# Altium schematic sheet Amplifier_Section.SchDoc
size A4; SheetNumber: 8; SheetTotal: 9
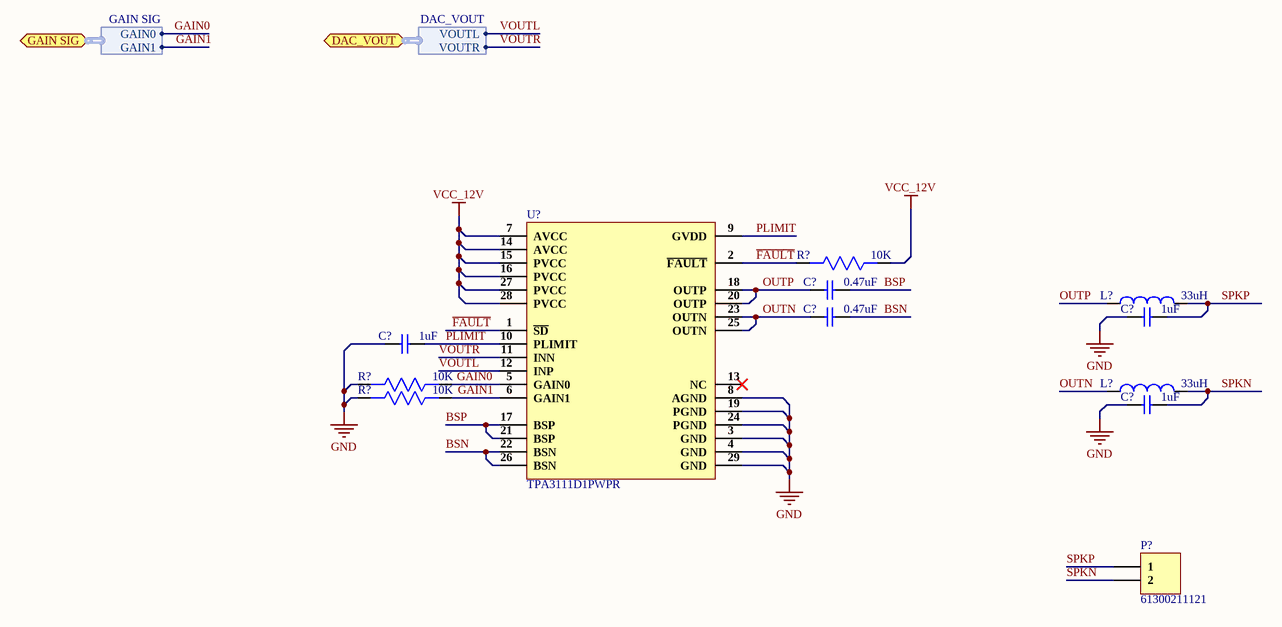
[diagram p0: Amplifier_Section.SchDoc]

## Parts
(Parts that share a designator on the sheet are numbered #1, #2 ... from top to bottom, then left to right.)
C?#1  0.47uF  [Cap0603]
C?#2  0.47uF  [Cap0603]
C?#3  1uF  [Cap0603]
C?#4  1uF  [Cap0603]
C?#5  1uF  [Cap0603]
L?#1  33uH  [SWPA5040S330MT]
L?#2  33uH  [SWPA5040S330MT]
P?  61300211121  [HDR1X2]
R?#1  10K  [Res0603]
R?#2  10K  [Res0603]
R?#3  10K  [Res0603]
U?  TPA3111D1PWPR  [28-HTSSOP]

## Ports
DAC_VOUT (bidir, harness DAC_VOUT), GAIN SIG (bidir, harness GAIN SIG)

## Harnesses
DAC_VOUT: VOUTL, VOUTR
GAIN SIG: GAIN0, GAIN1

## Nets
GND: C?#3.1 C?#4.1 C?#5.1 R?#2.2 R?#3.2 U?.3(GND) U?.4(GND) U?.8(AGND) U?.19(PGND) U?.24(PGND) U?.29(GND)
VCC_12V: R?#1.1 U?.7(AVCC) U?.14(AVCC) U?.15(PVCC) U?.16(PVCC) U?.27(PVCC) U?.28(PVCC)
~{FAULT}: R?#1.2 U?.1(~{SD}) U?.2(~{FAULT})
BSN: C?#2.2 U?.22(BSN) U?.26(BSN)
BSP: C?#1.2 U?.17(BSP) U?.21(BSP)
GAIN0: R?#2.1 U?.5(GAIN0) ; port GAIN SIG.GAIN0
GAIN1: R?#3.1 U?.6(GAIN1) ; port GAIN SIG.GAIN1
OUTN: C?#2.1 L?#2.1 U?.23(OUTN) U?.25(OUTN)
OUTP: C?#1.1 L?#1.1 U?.18(OUTP) U?.20(OUTP)
PLIMIT: C?#4.2 U?.9(GVDD) U?.10(PLIMIT)
SPKN: C?#5.2 L?#2.2 P?.2
SPKP: C?#3.2 L?#1.2 P?.1
VOUTL: U?.12(INP) ; port DAC_VOUT.VOUTL
VOUTR: U?.11(INN) ; port DAC_VOUT.VOUTR

Not connected (* = marked no-connect by the designer): U? 13(NC)*

## Notes on the sheet
- 1
- Huzaifa Ali

## Library data of the parts
C?#1 C?#2 = CL10A474KB8NNNC: CAP CER 0.47UF 50V X5R 0603; Manufacturer: Samsung; Tolerance: 10%; Capacitance: 470nF; Supplier 1: Arrow Electronics; Manufacturer Part Number: CL10A474KB8NNNC; RoHS: Yes; Category: Ceramic Capacitors; Stock 1: 196000; Pricing 1: 200000=0.04290, 300000=0.04250, 400000=0.04210, 500000=0.04170, 1000000=0.04120, 2000000=0.04080 (USD); Mount: Surface Mount; Case/Package: 0603; Case Code (Metric): 1608; Case Code (Imperial): 0603; Min Operating Temperature: -55°C; Max Operating Temperature: 85°C; Packaging: Tape and Reel; Package Quantity: 1; Voltage Rating: 50V; Dielectric: X5R; Series: CL; Construction: Flat; Voltage Rating (DC): 50V; Length: 1.6mm; Width: 0.031inch; Height: 0.8mm; Thickness: 0.035inch; Depth: 0.8mm; Radiation Hardening: No; RoHS Compliant: Yes; Lead Free: Lead Free; ComponentLink1URL: https://datasheet.ciiva.com/25798/cl10a474kb8nnnc-25798516.pdf?src-supplier=Digi-Key; ComponentLink1Description: https://datasheet.ciiva.com/25798/cl10a474kb8nnnc-25798516.pdf?src-supplier=Digi-Key; ComponentLink2URL: https://datasheet.ciiva.com/15195/getdatasheetpartid-353290-15195713.pdf?src-supplier=Verical; ComponentLink2Description: https://datasheet.ciiva.com/15195/getdatasheetpartid-353290-15195713.pdf?src-supplier=Verical; Supplier Part Number 1: CL10A474KB8NNNC
C?#3 C?#5 = UMK107AB7105KA-T: CAP CER 1UF 50V X7R 0603; Manufacturer: Taiyo Yuden; Tolerance: 10%; ComponentLink1URL: http://www.farnell.com/datasheets/2048165.pdf?src-supplier=Element14; ComponentLink1Description: http://www.farnell.com/datasheets/2048165.pdf?src-supplier=Element14; ComponentLink2URL: https://www.murata.com/~/media/webrenewal/support/library/catalog/products/capacitor/mlcc/c02e.ashx?la=en-us&src-supplier=Digi-Key; ComponentLink2Description: https://www.murata.com/~/media/webrenewal/support/library/catalog/products/capacitor/mlcc/c02e.ashx?la=en-us&src-supplier=Digi-Key; Supplier 1: Digi-Key; Manufacturer Part Number: UMK107AB7105KA-T; Stock 1: 453098; Pricing 1: 1=0.28, 10=0.19, 100=0.1079, 500=0.0762, 1000=0.0667 (USD); Mount: Surface Mount; Case/Package: 0603; Case Code (Metric): 1608; Case Code (Imperial): 0603; Min Operating Temperature: -55°C; Max Operating Temperature: 125°C; Packaging: Tape and Reel; Package Quantity: 1; Capacitance: 1uF; Voltage Rating: 50V; Voltage Rating (DC): 50V; Dielectric: X7R; Termination: SMD/SMT; Length: 1.6mm; Height: 0.8mm; Width: 0.031inch; Thickness: 0.037inch; Depth: 0.8mm; Radiation Hardening: No; Halogen Free: Halogen Free; ComponentLink3URL: https://www.yuden.co.jp/productdata/catalog/mlcc_all_e.pdf?src-supplier=Digi-Key; ComponentLink3Description: https://www.yuden.co.jp/productdata/catalog/mlcc_all_e.pdf?src-supplier=Digi-Key; ComponentLink4URL: https://www.yuden.co.jp/productdata/catalog/mlcc_all_e.pdf?src-supplier=Onlinecomponents.com; ComponentLink4Description: https://www.yuden.co.jp/productdata/catalog/mlcc_all_e.pdf?src-supplier=Onlinecomponents.com; Supplier Part Number 1: 587-3247-1-ND
C?#4 = CL10A105KA8NNNC: CAP CER 1UF 25V X5R 0603; Manufacturer: Sams; Tolerance: 10%; Supplier 1: Digi-Key; Manufacturer Part Number: CL10A105KA8NNNC; Stock 1: 2768758; Pricing 1: 1=0.1, 10=0.036, 50=0.0198, 100=0.0161, 500=0.01152, 1000=0.00904 (USD); Mount: Surface Mount; Case/Package: 0603; Min Operating Temperature: -55°C; Max Operating Temperature: 85°C; Capacitance: 1uF; Dielectric: X5R; Voltage Rating (DC): 25V; Voltage: 25V; Length: 1.6mm; Height: 0.8mm; Depth: 0.8mm; Lead Free: Lead Free; Supplier Part Number 1: 1276-1102-1-ND
L?#1 L?#2 = SWPA5040S330MT: Fixed Ind 3320%UH 0.188 Ohm 1450M; Manufacturer: Sunlord; Supplier 1: Digi-Key; Manufacturer Part Number: SWPA5040S330MT; RoHS: Yes; Category: Fixed Inductors; Pricing 1: 1500=0.24990 (USD); RoHS Compliant: Yes; Supplier Part Number 1: 3442-SWPA5040S330MTTR-ND
P? = 61300211121: CONN HEADER VERT 2POS 2.54MM; Manufacturer: Wurth Electronics; Current Rating: 3A; Voltage Rating: 250V; Number of Positions: 2; Gender: Male; Connector Type: Male Pin; Pitch: 0.1inch; Supplier 1: Digi-Key; Manufacturer Part Number: 61300211121; Stock 1: 219205; Pricing 1: 1=0.13, 10=0.106, 25=0.088, 50=0.074, 100=0.067, 1000=0.061 (USD); Mount: Through Hole; Contact Plating: Gold; Housing Material: PBT; Contact Material: Copper Alloy,Copper; Color: Black; Min Operating Temperature: -40°C; Max Operating Temperature: 125°C; Number of Rows: 1; Contact Gender: Male; Packaging: Bulk; Termination: Through Hole; Number of Contacts: 2; Contact Mating Length: 0.236inch; REACH SVHC: Unknown; Lead Free: Lead Free; ComponentLink1URL: http://www.mouser.com/ds/2/445/6130xx11121-538006.pdf?src-supplier=Mouser; ComponentLink1Description: http://www.mouser.com/ds/2/445/6130xx11121-538006.pdf?src-supplier=Mouser; Supplier Part Number 1: 732-5315-ND
R?#1-R?#3 = AC0603JR-0710KL: RES SMD 10K OHM 5% 1/10W 0603; Manufacturer: Yageo; Voltage Rating: 50V; Resistance: 10kR; Power Rating: 100mW; Temperature Coefficient: 100ppm/°C; Supplier 1: Future Electronics; Manufacturer Part Number: AC0603JR-0710KL; RoHS: Yes; Category: Chip SMD Resistors; Stock 1: 1533000; Pricing 1: 5000=0.00540 (USD); Case/Package: 0603; Case Code (Imperial): 0603; Case Code (Metric): 1608; Size Code: 0603; Min Operating Temperature: -55°C; Max Operating Temperature: 155°C; Packaging: Tape and Reel; Tolerance: 5%; Package Quantity: 1; Resistor Type: Thick Film; Termination: SMD/SMT; Number of Terminations: 2; Max Power Dissipation: 100mW; Features: Moisture Resistant,Automotive AEC-Q200,Anti-Sulfur; Series: AC; Construction: Rectangular; Length: 0.063inch; Width: 0.031inch; Height: 0.022inch; Depth: 0.8mm; Military Standard: Not; Lead Free: Lead Free; RoHS Compliant: Yes; ComponentLink1URL: https://datasheet.ciiva.com/5562/pyu-ac-51-rohs-l-2-5562553.pdf?src-supplier=Mouser; ComponentLink1Description: https://datasheet.ciiva.com/5562/pyu-ac-51-rohs-l-2-5562553.pdf?src-supplier=Mouser; Supplier Part Number 1: 1029044
U? = TPA3111D1PWPR: Amplifier IC 1-Channel (Mono) Class D 28-HTSSOP; Manufacturer: Texas Instruments; Output Power: 10W; Min Supply Voltage: 8V; Max Supply Voltage: 26V; Nominal Supply Current: 40mA; Power Dissipation: 4.98W; Number of Channels: 1; Voltage Gain: 36dB; Gain: 37dB; Load Impedance: 8R; Supplier 1: Mouser; Manufacturer Part Number: TPA3111D1PWPR; RoHS: Yes; Category: Amplifiers - Audio; Pricing 1: 1=2.26000, 10=2.04000, 25=1.92000, 50=1.92000, 100=1.64000, 250=1.54000, 500=1.35000, 1000=1.12000, 2000=1.11000, 10000=1.11000 (USD); Case/Package: HTSSOP; Number of Pins: 28; Min Operating Temperature: -40°C; Max Operating Temperature: 85°C; Packaging: Tape and Reel; Package Quantity: 2000; Max Output Power: 10W; Series: SpeakerGuard™; Supply Current: 40mA; Radiation Hardening: No; Lead Free: Lead Free; RoHS Compliant: Yes; REACH SVHC: No SVHC; ComponentLink1URL: https://datasheet.ciiva.com/15131/getdatasheetpartid-376403-15131942.pdf?src-supplier=Verical; ComponentLink1Description: https://datasheet.ciiva.com/15131/getdatasheetpartid-376403-15131942.pdf?src-supplier=Verical; ComponentLink2URL: https://datasheet.ciiva.com/2969/tpa3111d1-2969959.pdf?src-supplier=Avnet; ComponentLink2Description: https://datasheet.ciiva.com/2969/tpa3111d1-2969959.pdf?src-supplier=Avnet; ComponentLink3URL: https://datasheet.ciiva.com/1789/tpa3111d1-1789051.pdf?src-supplier=Digi-Key; ComponentLink3Description: https://datasheet.ciiva.com/1789/tpa3111d1-1789051.pdf?src-supplier=Digi-Key; Supplier Part Number 1: 595-TPA3111D1PWPR